# Altium schematic sheet P1.schdoc
size 297 x 209 mm; Symbol: Drawing-Symbol_A4; @Project Name: MIDI Controller; @Page Count: 1; @Update Date: 2026-10-21; @Create Date: 2026-10-21; @Schematic Name: Schematic1; @Page No: 1; @Page Name: P1; Company: EasyEDA.com; Version: V1.0; Page Size: A4; Device: Drawing-Symbol_A4; @Create Time: 21:57:29; @Update Time: 21:57:29; Border: 1; Width: 1170; Height: 825; Region Start: 1; X Region Count: 6; Y Region Count: 4; Blade Width: 10; Title Block Position: 3; @Board Name: Board1
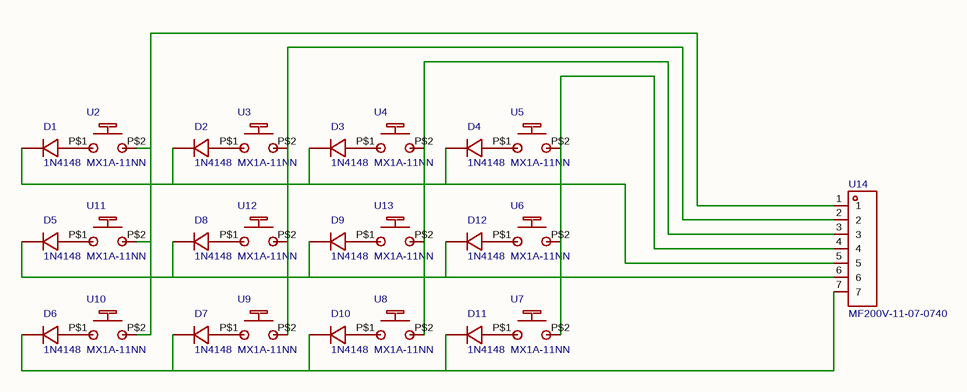
[diagram p0: P1.schdoc]

## Parts
D1  1N4148  [SOD-523_L1.2-W0.8-LS1.6-BI-1]
D2  1N4148  [SOD-523_L1.2-W0.8-LS1.6-BI-1]
D3  1N4148  [SOD-523_L1.2-W0.8-LS1.6-BI-1]
D4  1N4148  [SOD-523_L1.2-W0.8-LS1.6-BI-1]
D5  1N4148  [SOD-523_L1.2-W0.8-LS1.6-BI-1]
D6  1N4148  [SOD-523_L1.2-W0.8-LS1.6-BI-1]
D7  1N4148  [SOD-523_L1.2-W0.8-LS1.6-BI-1]
D8  1N4148  [SOD-523_L1.2-W0.8-LS1.6-BI-1]
D9  1N4148  [SOD-523_L1.2-W0.8-LS1.6-BI-1]
D10  1N4148  [SOD-523_L1.2-W0.8-LS1.6-BI-1]
D11  1N4148  [SOD-523_L1.2-W0.8-LS1.6-BI-1]
D12  1N4148  [SOD-523_L1.2-W0.8-LS1.6-BI-1]
U2  MX1A-11NN  [CHERRY_MX1A-11NN_SWITCH]
U3  MX1A-11NN  [CHERRY_MX1A-11NN_SWITCH]
U4  MX1A-11NN  [CHERRY_MX1A-11NN_SWITCH]
U5  MX1A-11NN  [CHERRY_MX1A-11NN_SWITCH]
U6  MX1A-11NN  [CHERRY_MX1A-11NN_SWITCH]
U7  MX1A-11NN  [CHERRY_MX1A-11NN_SWITCH]
U8  MX1A-11NN  [CHERRY_MX1A-11NN_SWITCH]
U9  MX1A-11NN  [CHERRY_MX1A-11NN_SWITCH]
U10  MX1A-11NN  [CHERRY_MX1A-11NN_SWITCH]
U11  MX1A-11NN  [CHERRY_MX1A-11NN_SWITCH]
U12  MX1A-11NN  [CHERRY_MX1A-11NN_SWITCH]
U13  MX1A-11NN  [CHERRY_MX1A-11NN_SWITCH]
U14  MF200V-11-07-0740  [CONN-TH_MF200V-11-07-0740]

## Nets
NetD1_1: D1.1(K) D2.1(K) D3.1(K) D4.1(K) U14.5
NetD1_2: D1.2(A) U2.P$1(P)
NetD2_2: D2.2(A) U3.P$1(P)
NetD3_2: D3.2(A) U4.P$1(P)
NetD4_2: D4.2(A) U5.P$1(P)
NetD5_1: D5.1(K) D8.1(K) D9.1(K) D12.1(K) U14.6
NetD5_2: D5.2(A) U11.P$1(P)
NetD6_1: D6.1(K) D7.1(K) D10.1(K) D11.1(K) U14.7
NetD6_2: D6.2(A) U10.P$1(P)
NetD7_2: D7.2(A) U9.P$1(P)
NetD8_2: D8.2(A) U12.P$1(P)
NetD9_2: D9.2(A) U13.P$1(P)
NetD10_2: D10.2(A) U8.P$1(P)
NetD11_2: D11.2(A) U7.P$1(P)
NetD12_2: D12.2(A) U6.P$1(P)
NetU2_P$2: U2.P$2(S) U10.P$2(S) U11.P$2(S) U14.1
NetU3_P$2: U3.P$2(S) U9.P$2(S) U12.P$2(S) U14.2
NetU4_P$2: U4.P$2(S) U8.P$2(S) U13.P$2(S) U14.3
NetU5_P$2: U5.P$2(S) U6.P$2(S) U7.P$2(S) U14.4

## Notes on the sheet
- Create at
- 2026-10-21
- Schematic
- Board
- Schematic1
- Board1
- Update at
- Page
- P1
- Drawn
- Reviewed
- MIDI Controller
- Version
- V1.0
- Size
- A4
- Page  1  Total  1
- EasyEDA.com

## Library data of the parts
D1-D12 = 1N4148: Manufacturer: ST(先科); ManufacturerPart: 1N4148W; ConvertToPcb: yes; ModelId: 79671b073d6c4ad28d0a185bc46cde662f38656c0e604226a64341566d339f5c; Symbol: 1N4148; Device: 1N4148; Supplier: LCSC; SupplierPart: C81598; JLCPCB Part Class: Basic Part; link: https://lcsc.com/eda_search?q=C81598&%26type=1&ref=editor; AddInBom: yes; FootprintName: SOD-523_L1.2-W0.8-LS1.6-BI-1; ModelName: SOD-523_L1.2-W0.8-LS1.6-BI-1
U2-U13 = MX1A-11NN: AddInBom: yes; Symbol: MX1A-11NN; Device: MX1A-11NN; FootprintName: CHERRY_MX1A-11NN_SWITCH; ConvertToPcb: yes
U14 = MF200V-11-07-0740: AddInBom: yes; ModelId: 5033b1cbf7774a3a9e4a92a293cda29e118df24ec4f74a47b1868b0d19b2cf42; ModelTransform: 551.18,165.354,0,0,0,0,0,0,-118.11; Symbol: MF200V-11-07-0740; Device: MF200V-11-07-0740; LCSC Part Name: MF200V-11-07-0740; SupplierPart: C9900000607; ManufacturerPart: MF200V-11-07-0740; Supplier Footprint: HDR-TH_1x7P_P2.00; JLCPCB Part Class: Extended Part; Supplier: LCSC; ConvertToPcb: yes; ModelName: CONN-TH_MF200V-11-07-0740; FootprintName: CONN-TH_MF200V-11-07-0740